# EasyEDA Pro project 云台PCB.epro

# Schematic Schematic1_1
Board Name: Board1_1; Create Date: 2026-03-31; Page Name: P1; Project Name: PT_head; Schematic Name: Schematic1_1; Update Date: 2026-03-31; Company: 嘉立创EDA; Page Size: A4; Version: V1.0
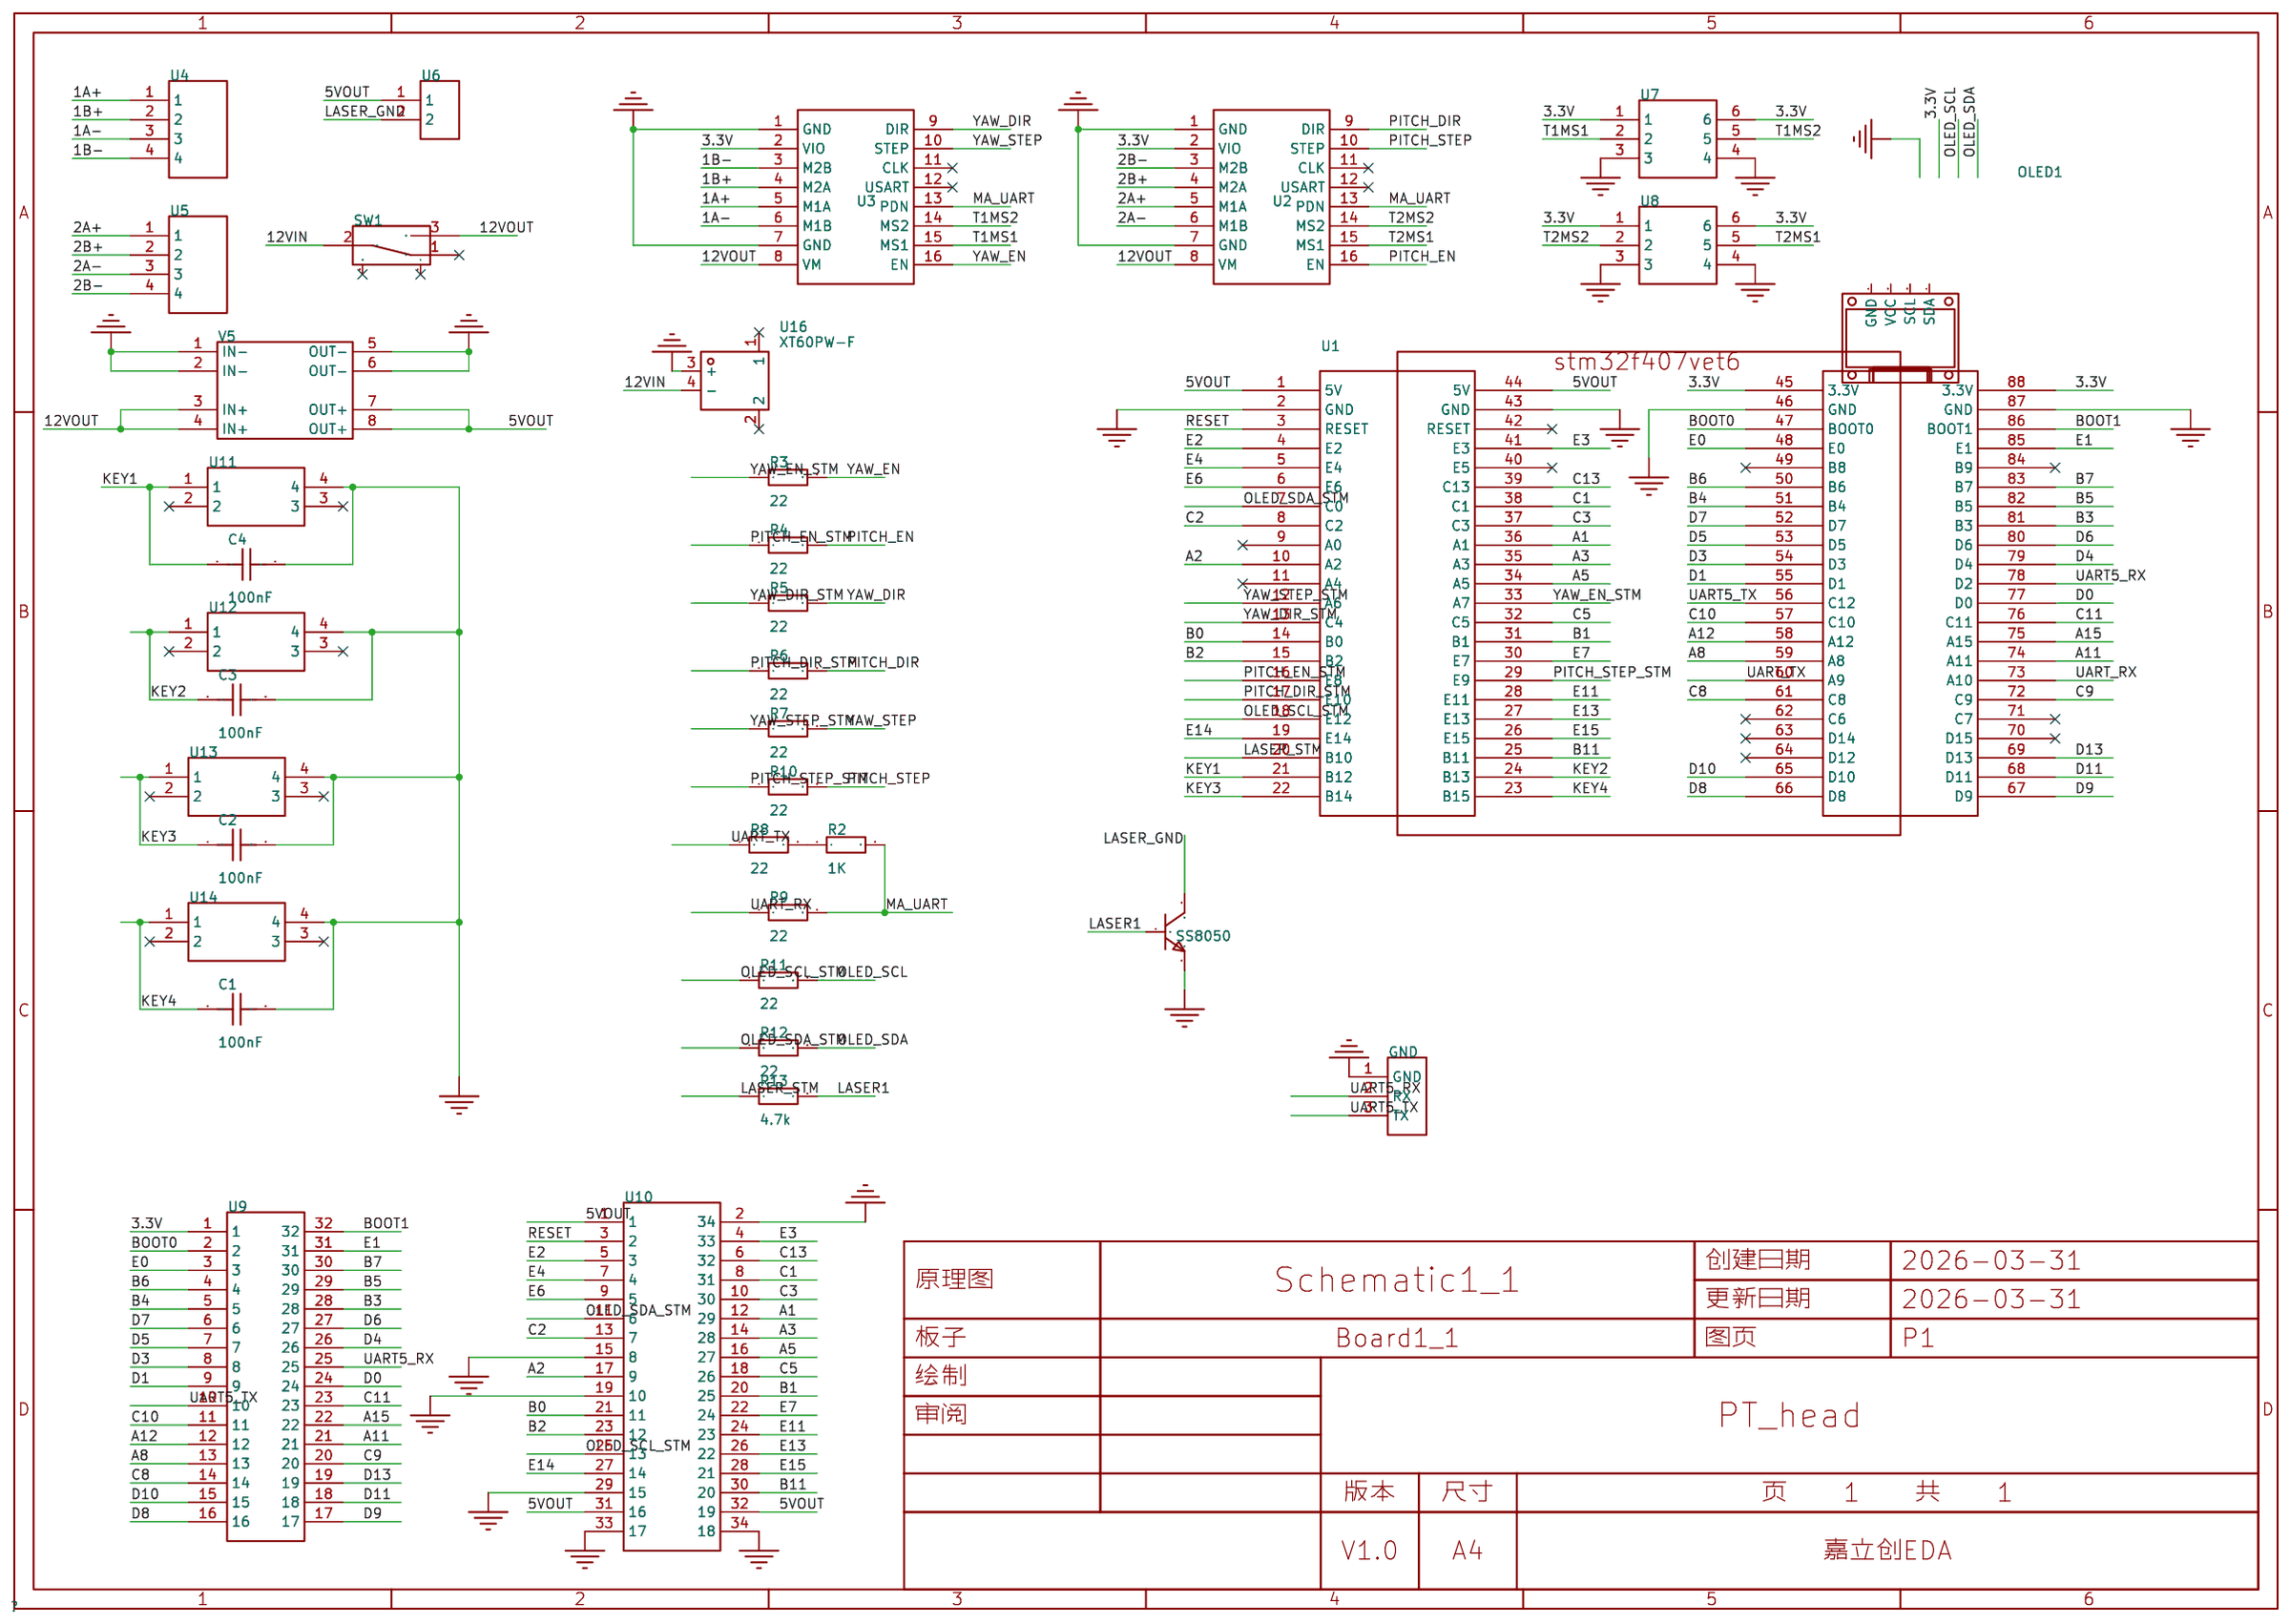
[diagram p0: schematic sheet]

## Parts
C1  100nF  [C0805]
C2  100nF  [C0805]
C3  100nF  [C0805]
C4  100nF  [C0805]
GND  -  [3PIN]
OLED1  -  [0.96OLED_4P]
Q1  SS8050  [SS8050]
R2  1K  [R0805]
R3  22  [R0805]
R4  22  [R0805]
R5  22  [R0805]
R6  22  [R0805]
R7  22  [R0805]
R8  22  [R0805]
R9  22  [R0805]
R10  22  [R0805]
R11  22  [R0805]
R12  22  [R0805]
R13  4.7k  [R0805]
SW1  -  [拨动开关_侧]
U1  -  [STM32核心板_V5]
U2  TMC2209  [TMC2209]
U3  TMC2209  [TMC2209]
U4  -  [2.54*4]
U5  -  [2.54*4]
U6  -  [1*2P]
U7  -  [2*3p]
U8  -  [2*3p]
U9  -  [2*16pin_2.54]
U10  -  [2*17P-2.54]
U11  -  [按键]
U12  -  [按键]
U13  -  [按键]
U14  -  [按键]
U16  XT60PW-F  [TH_2P-XT60PW-F]
V5  -  [MP1584EN]

## Library data of the parts
C1-C4 = CAP_0805: Supplier Footprint: 0805
GND = uart
OLED1 = 0.96OLED模块_4P: Supplier Footprint: 插件
Q1 = SS8050: Supplier: LCSC; Manufacturer: CJ; image: //image.lceda.cn/szlcsc/C2150.jpg; Supplier Part: C2150; JLCPCB Part Class: Basic
R2-R13 = Res_0805: Supplier Footprint: 0805
SW1 = 拨动开关_侧: Supplier Footprint: 插件
U1 = stm32f407vet6内置daplink
U2 U3 = TMC2209
U4 U5 = 2.54*4
U6 = laser2pin
U7 U8 = tmc2209地址
U9 = stm32排针2
U10 = stm32排针1
U11-U14 = 按键
U16 = XT60PW-F: LCSC Part Name: AMASS(艾迈斯)插头锂电池组充电接头 线到板连接器大电流30A连接器 航模电调卧式焊板 母头XT60PW-F.G.Y; Supplier Part: C428722; Manufacturer: AMASS(艾迈斯); JLCPCB Part Class: Extended Part; Datasheet: https://item.szlcsc.com/datasheet/XT60PW-F/423834.html; Supplier: LCSC; colour: 黄色; Connector type: 卧式插头; interface form: 母头
V5 = MP1584EN

## Nets
3.3V: U1.45(3.3V) U1.88(3.3V) U2.2(VIO) U3.2(VIO) U7.1 U7.6 U8.1 U8.6 U9.1
5VOUT: U1.1(5V) U1.44(5V) U6.1 U10.1 U10.31(16) U10.32(19) V5.7(OUT+) V5.8(OUT+)
12VIN: SW1.2 U16.4(-)
12VOUT: SW1.3 U2.8(VM) U3.8(VM) V5.3(IN+) V5.4(IN+)
GND: C1.2 C2.2 C3.2 C4.2 GND.1(GND) Q1.2(E) U1.2(GND) U1.43(GND) U1.46(GND) U1.87(GND) U2.1(GND) U2.7(GND) U3.1(GND) U3.7(GND) U7.3 U7.4 U8.3 U8.4 U10.2(34) U10.15(8) U10.19(10) U10.29(15) U10.33(17) U10.34(18) U11.4 U12.4 U13.4 U14.4 U16.3(+) V5.1(IN-) V5.2(IN-) V5.5(OUT-) V5.6(OUT-)
1A+: U3.5(M1A) U4.1
1A-: U3.6(M1B) U4.3
1B+: U3.4(M2A) U4.2
1B-: U3.3(M2B) U4.4
2A+: U2.5(M1A) U5.1
2A-: U2.6(M1B) U5.3
2B+: U2.4(M2A) U5.2
2B-: U2.3(M2B) U5.4
A1: U1.36(A1) U10.12(29)
A2: U1.10(A2) U10.17(9)
A3: U1.35(A3) U10.14(28)
A5: U1.34(A5) U10.16(27)
A8: U1.59(A8) U9.13
A11: U1.74(A11) U9.21
A12: U1.58(A12) U9.12
A15: U1.75(A15) U9.22
B0: U1.14(B0) U10.21(11)
B1: U1.31(B1) U10.20(25)
B2: U1.15(B2) U10.23(12)
B3: U1.81(B3) U9.28
B4: U1.51(B4) U9.5
B5: U1.82(B5) U9.29
B6: U1.50(B6) U9.4
B7: U1.83(B7) U9.30
B11: U1.25(B11) U10.30(20)
BOOT0: U1.47(BOOT0) U9.2
BOOT1: U1.86(BOOT1) U9.32
C1: U1.38(C1) U10.8(31)
C2: U1.8(C2) U10.13(7)
C3: U1.37(C3) U10.10(30)
C5: U1.32(C5) U10.18(26)
C8: U1.61(C8) U9.14
C9: U1.72(C9) U9.20
C10: U1.57(C10) U9.11
C11: U1.76(C11) U9.23
C13: U1.39(C13) U10.6(32)
D0: U1.77(D0) U9.24
D1: U1.55(D1) U9.9
D3: U1.54(D3) U9.8
D4: U1.79(D4) U9.26
D5: U1.53(D5) U9.7
D6: U1.80(D6) U9.27
D7: U1.52(D7) U9.6
D8: U1.66(D8) U9.16
D9: U1.67(D9) U9.17
D10: U1.65(D10) U9.15
D11: U1.68(D11) U9.18
D13: U1.69(D13) U9.19
E0: U1.48(E0) U9.3
E1: U1.85(E1) U9.31
E2: U1.4(E2) U10.5(3)
E3: U1.41(E3) U10.4(33)
E4: U1.5(E4) U10.7(4)
E6: U1.6(E6) U10.9(5)
E7: U1.30(E7) U10.22(24)
E11: U1.28(E11) U10.24(23)
E13: U1.27(E13) U10.26(22)
E14: U1.19(E14) U10.27(14)
E15: U1.26(E15) U10.28(21)
KEY1: C4.1 U1.21(B12) U11.1
KEY2: C3.1 U1.24(B13) U12.1
KEY3: C2.1 U1.22(B14) U13.1
KEY4: C1.1 U1.23(B15) U14.1
LASER1: Q1.1(B) R13.2
LASER_GND: Q1.3(C) U6.2
LASER_STM: R13.1 U1.20(B10)
MA_UART: R2.2 R9.2 U2.13(PDN) U3.13(PDN)
OLED_SCL: R11.2
OLED_SCL_STM: R11.1 U1.18(E12) U10.25(13)
OLED_SDA: R12.2
OLED_SDA_STM: R12.1 U1.7(C0) U10.11(6)
PITCH_DIR: R6.2 U2.9(DIR)
PITCH_DIR_STM: R6.1 U1.17(E10)
PITCH_EN: R4.2 U2.16(EN)
PITCH_EN_STM: R4.1 U1.16(E8)
PITCH_STEP: R10.2 U2.10(STEP)
PITCH_STEP_STM: R10.1 U1.29(E9)
RESET: U1.3(RESET) U10.3(2)
T1MS1: U3.15(MS1) U7.2
T1MS2: U3.14(MS2) U7.5
T2MS1: U2.15(MS1) U8.5
T2MS2: U2.14(MS2) U8.2
UART5_RX: GND.2(RX) U1.78(D2) U9.25
UART5_TX: GND.3(TX) U1.56(C12) U9.10
UART_RX: R9.1 U1.73(A10)
UART_TX: R8.1 U1.60(A9)
YAW_DIR: R5.2 U3.9(DIR)
YAW_DIR_STM: R5.1 U1.13(C4)
YAW_EN: R3.2 U3.16(EN)
YAW_EN_STM: R3.1 U1.33(A7)
YAW_STEP: R7.2 U3.10(STEP)
YAW_STEP_STM: R7.1 U1.12(A6)
$1N2243: R2.1 R8.2

Not connected (* = marked no-connect by the designer): OLED1 1(GND) 2(VCC) 3(SCL) 4(SDA); SW1 1* 4* 5*; U1 9(A0)* 11(A4)* 40(E5)* 42(RESET)* 49(B8)* 62(C6)* 63(D14)* 64(D12)* 70(D15)* 71(C7)* 84(B9)*; U2 11(CLK)* 12(USART)*; U3 11(CLK)* 12(USART)*; U11 2* 3*; U12 2* 3*; U13 2* 3*; U14 2* 3*; U16 1* 2*

# Board PCB1_1
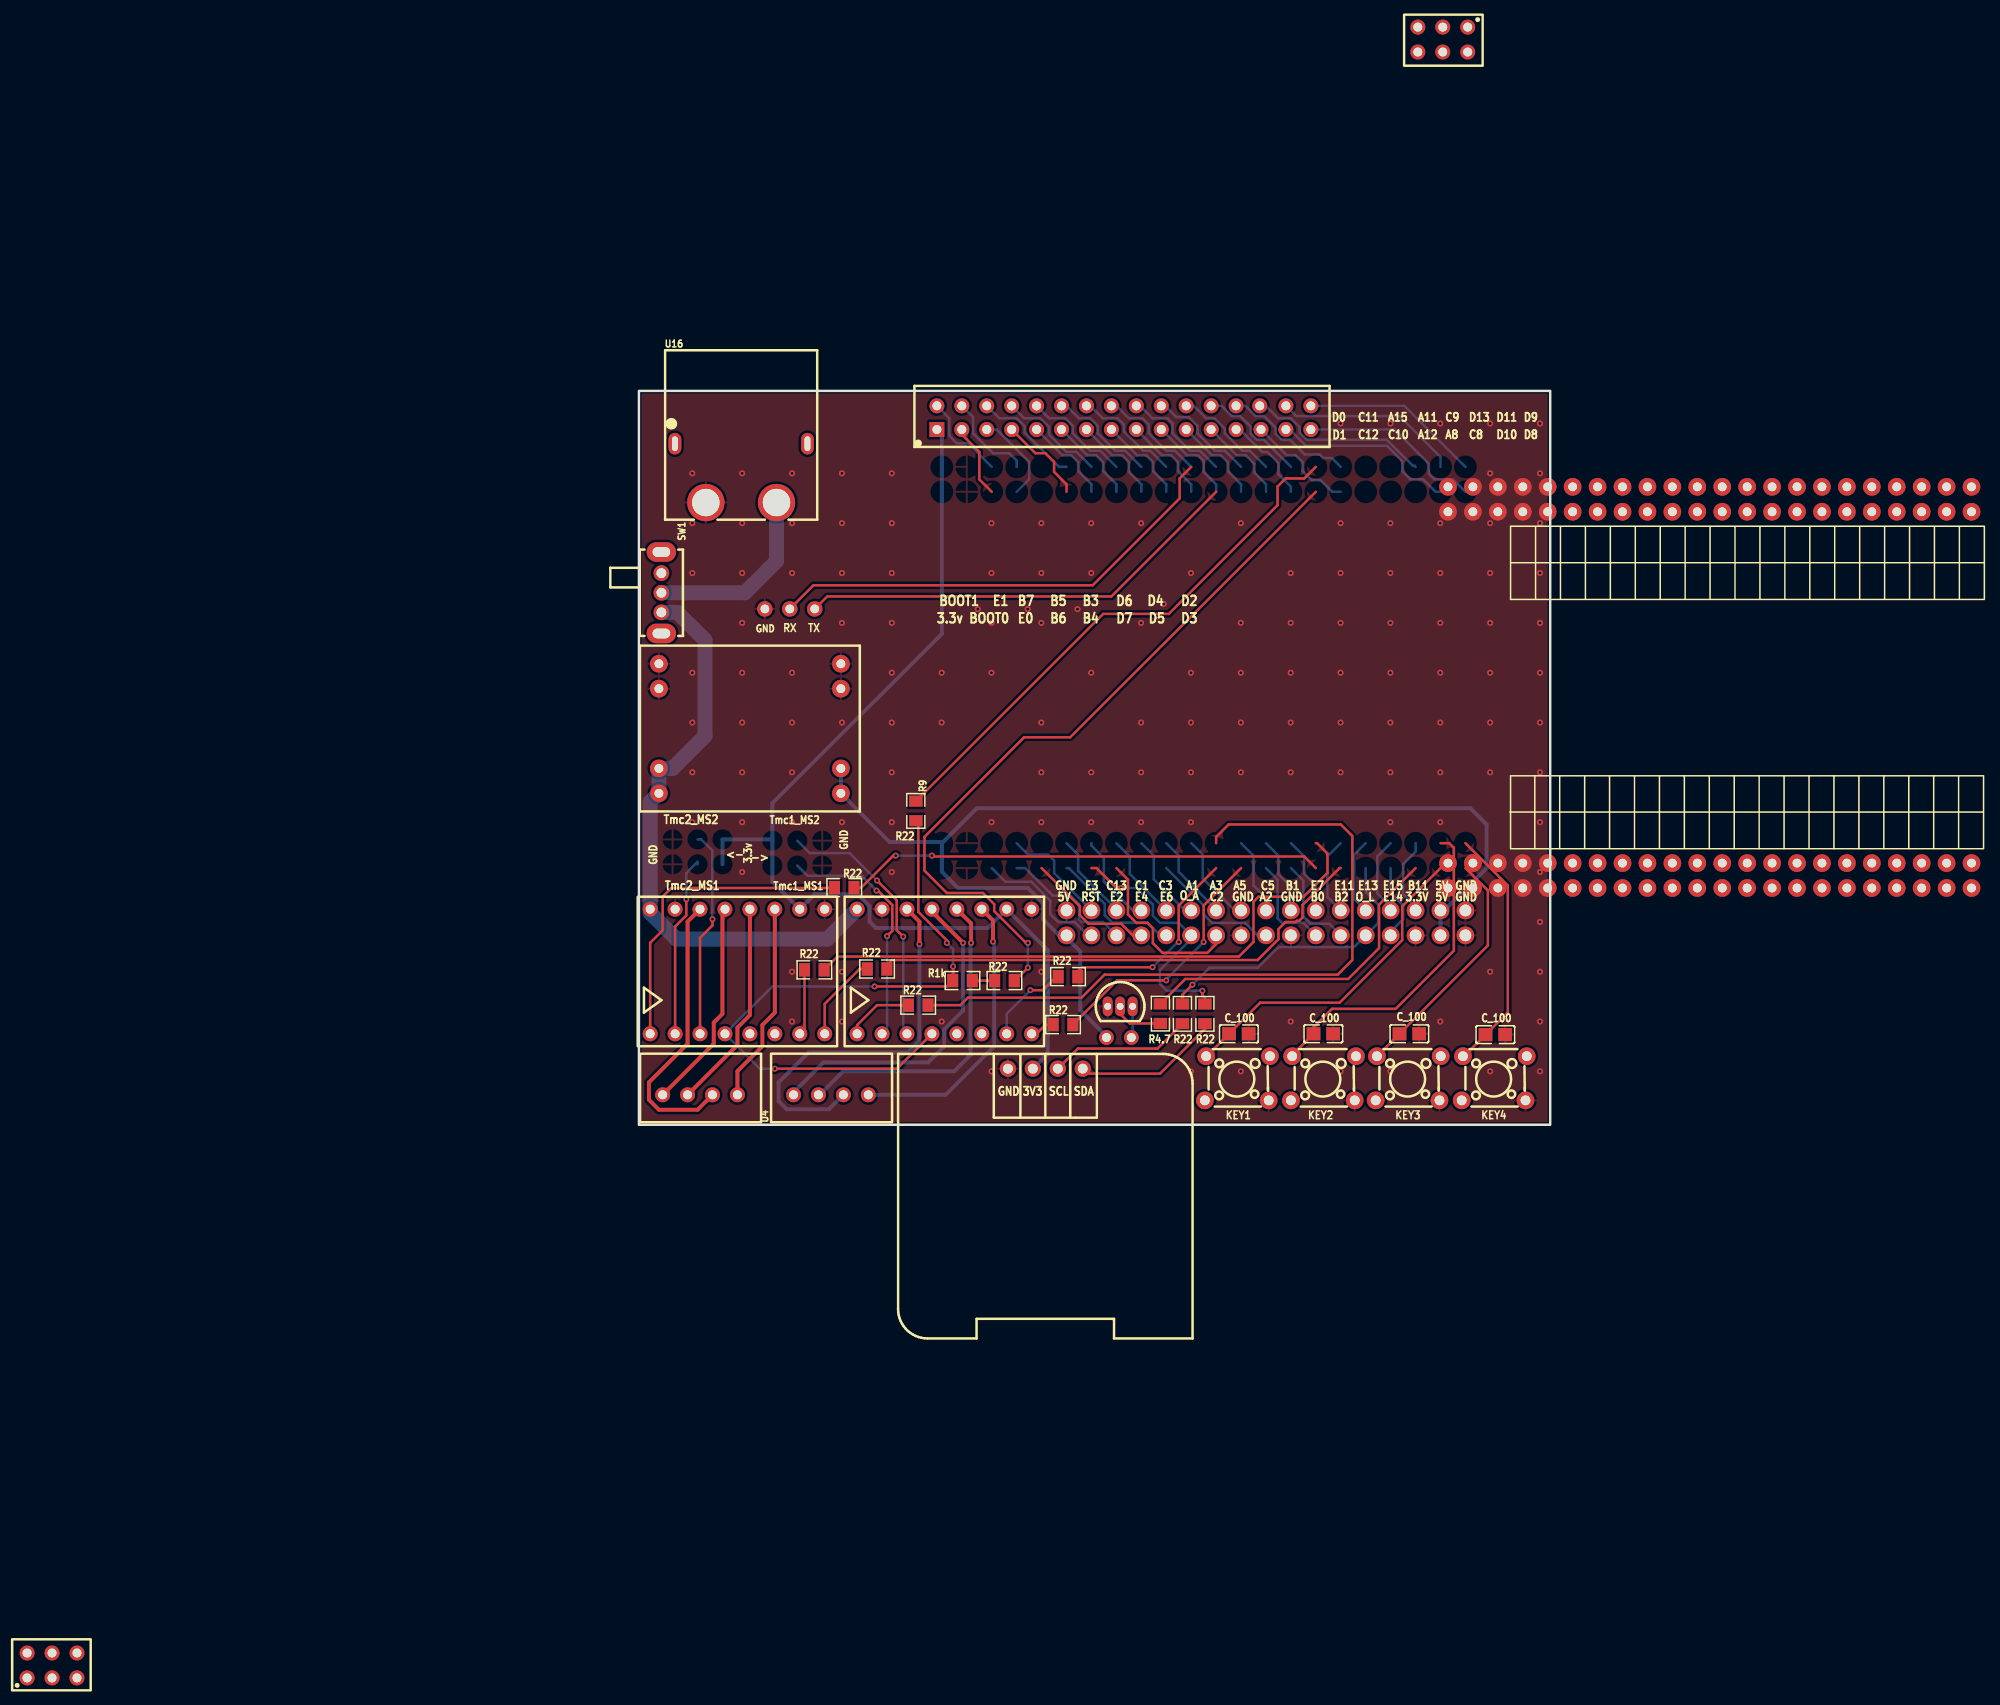
[diagram p1: board, top side]
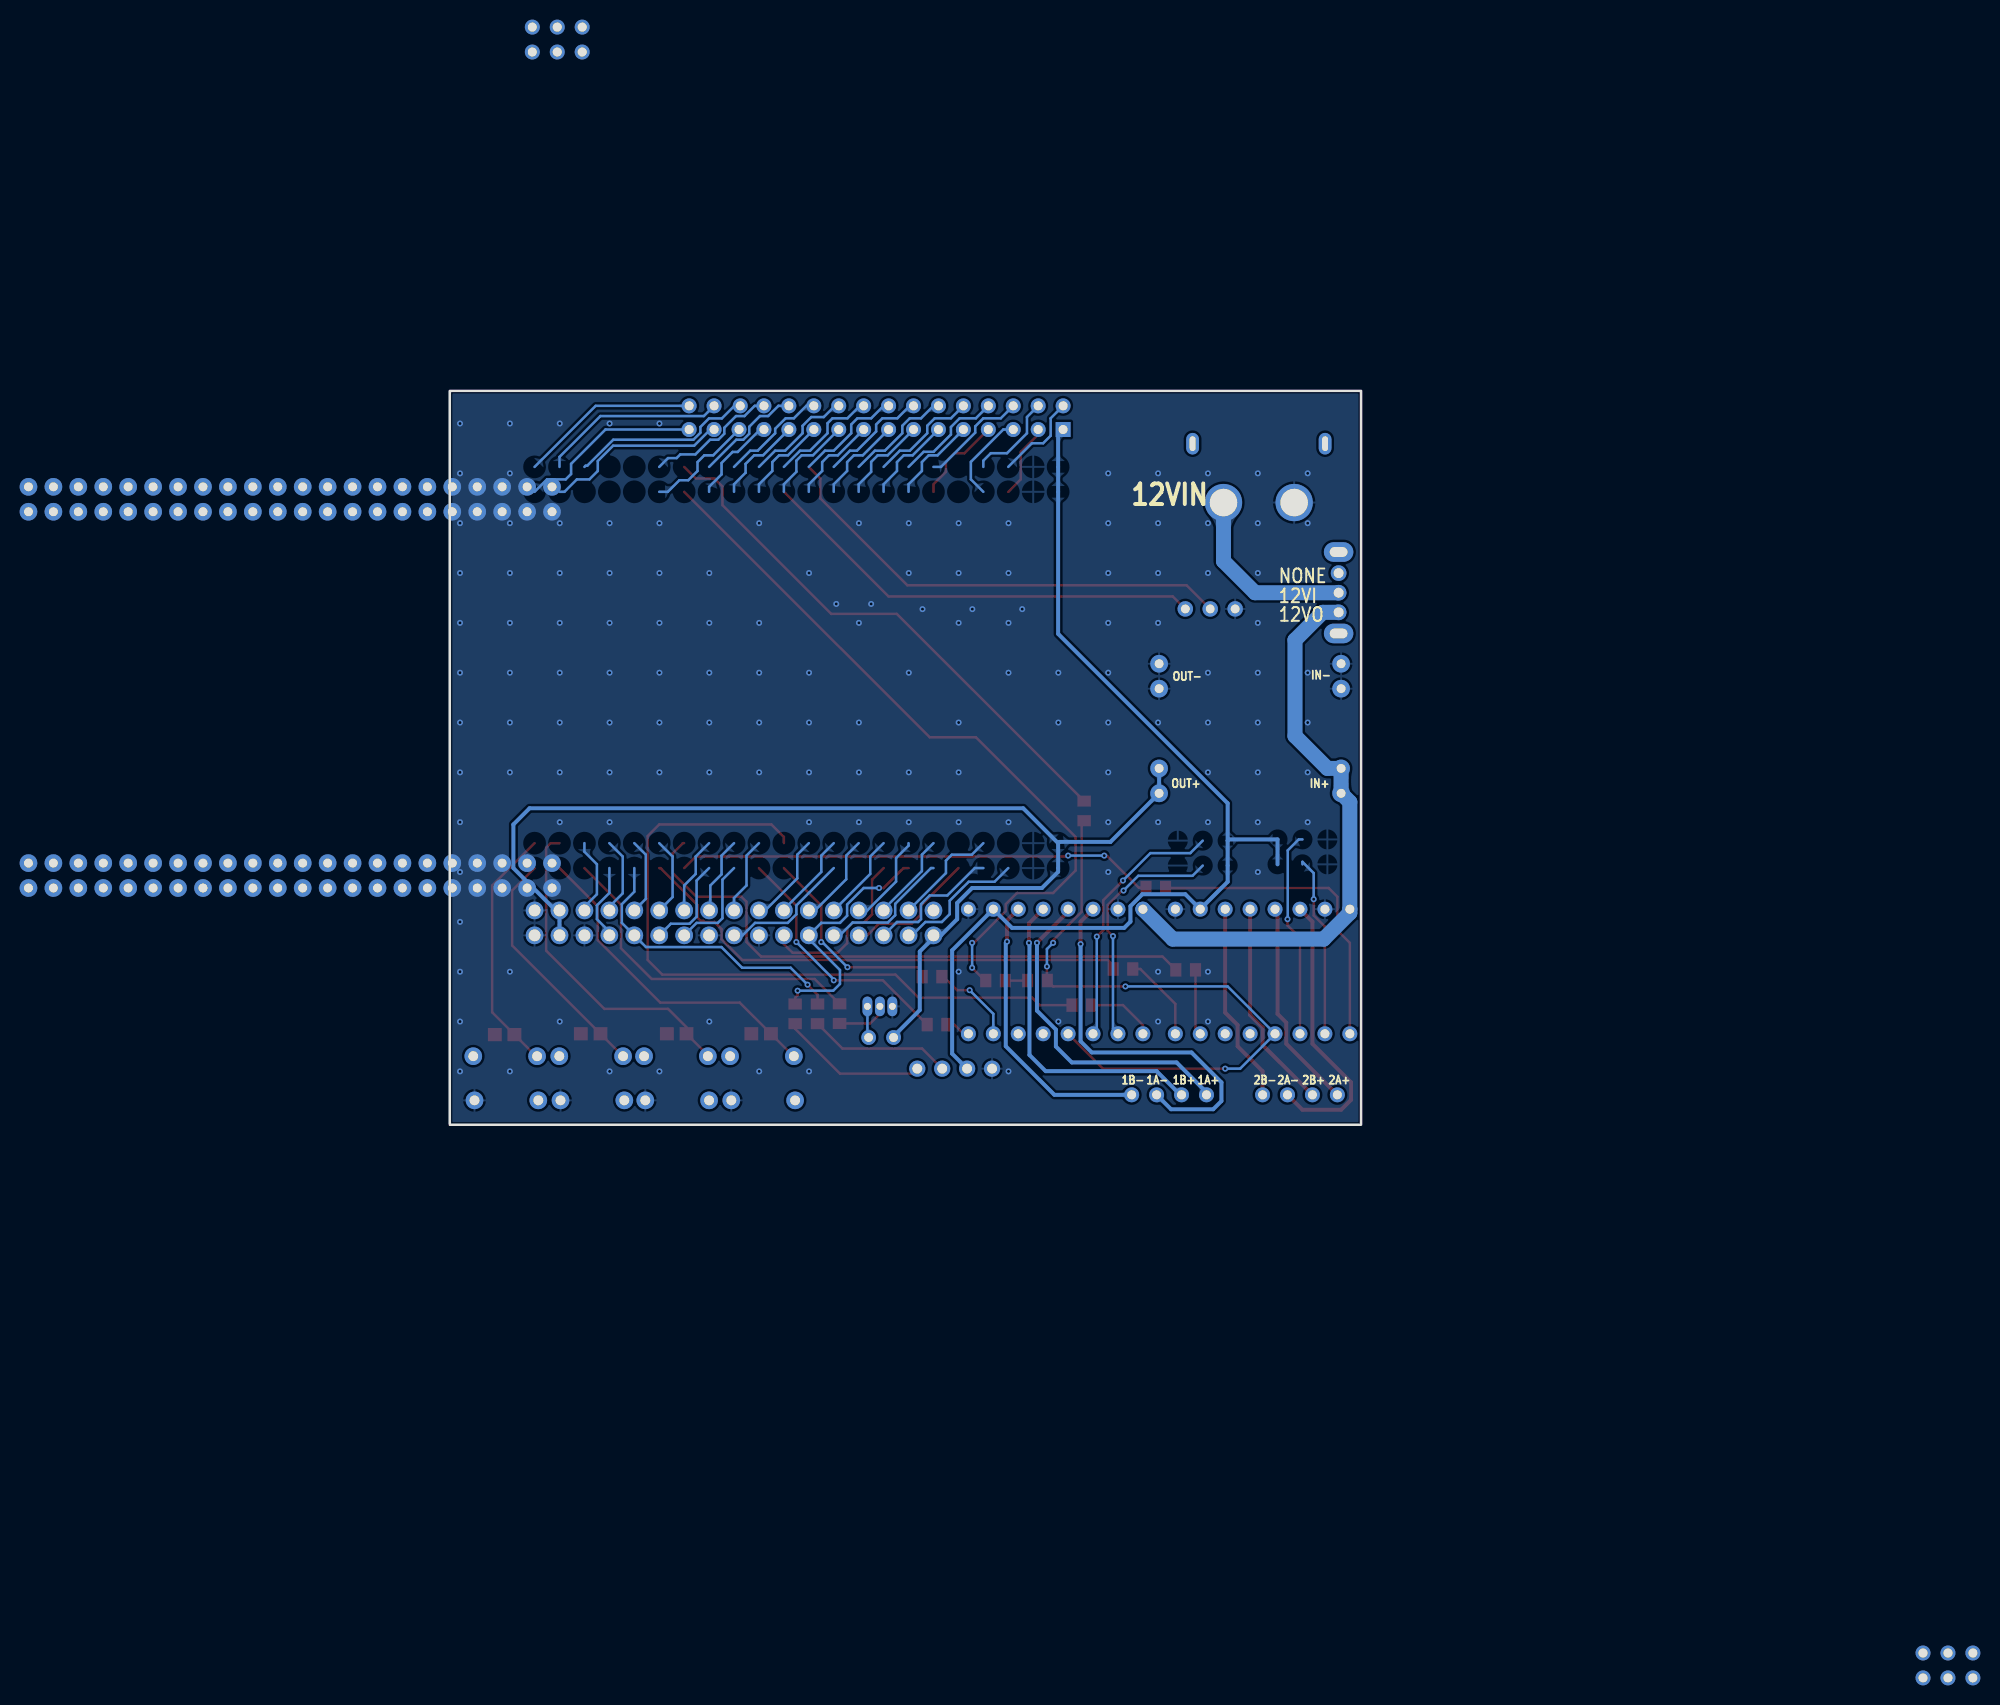
[diagram p2: board, bottom side, seen from below]

Outline 92.84 x 74.8 mm; copper layers: Top Layer, Bottom Layer. Coordinates in mm from the lower left corner of the outline.
Outline path: rectangle 0,74.8 92.84,0
Stack: Top Layer 0.035mm / Dielectric1 1.51mm FR4 er 4.5 / Bottom Layer 0.035mm

## Design rules (mm)
spacing copperThickness1oz (default): track to track 0.102, other pairs 0.152 to 0.3
spacing copperThickness2oz: track to track 0.203, other pairs 0.152 to 0.3
spacing Plane_innerPlane: track to track 0.102, other pairs 0.152 to 0.3
spacing Copper_copperRegion: track to track 0.102, other pairs 0.152 to 0.3
track width copperThickness1oz (default): min 0.127, default 0.254, max 2.54
track width copperThickness2oz: min 0.203, default 0.254, max 2.54
differential pair differentialPair (default): width min 0.127, default 0.254, max 2.54; gap min 0.152, default 0.152
pour e818 uses Copper_copperRegion
pour e934 uses Copper_copperRegion

## Placement (name value [footprint] x y rotation side)
C1  100nF  [C0805]  87.25 9.18 0 top
C2  100nF  [C0805]  78.49 9.27 0 top
C3  100nF  [C0805]  69.72 9.27 0 top
C4  100nF  [C0805]  61.12 9.27 0 top
GND  -  [3PIN]  15.37 52.58 0 top
OLED1  -  [0.96OLED_4P]  41.4 5.72 0 top
Q1  -  [SS8050]  49.02 12.06 0 top
R2  1K  [R0805]  32.96 14.7 180 top
R3  22  [R0805]  28.45 12.19 180 top
R4  22  [R0805]  20.91 24.17 180 top
R5  22  [R0805]  43.2 10.21 180 top
R6  22  [R0805]  24.26 15.88 180 top
R7  22  [R0805]  43.71 15.1 180 top
R8  22  [R0805]  37.23 14.7 180 top
R9  22  [R0805]  28.21 31.99 270 top
R10  22  [R0805]  17.87 15.79 180 top
R11  22  [R0805]  55.37 11.3 270 top
R12  22  [R0805]  57.66 11.3 270 top
R13  4.7k  [R0805]  53.12 11.32 270 top
SW1  -  [拨动开关_侧]  2.29 54.23 270 top
U1  -  [STM32核心板_V5]  84.2 26.16 90 top
U2  -  [TMC2209]  20.32 23.37 270 top
U3  -  [TMC2209]  41.4 23.37 270 top
U4  -  [2.54*4]  20.95 3.05 90 top
U5  -  [2.54*4]  7.62 3.05 90 top
U6  -  [1*2P]  48.9 8.89 90 top
U7  -  [2*3p]  18.67 26.42 90 top
U8  -  [2*3p]  3.43 29.08 270 top
U9  -  [2*16pin_2.54]  48.01 71.88 0 top
U10  -  [2*17P-2.54]  52.45 20.57 0 top
U11  -  [按键]  91.06 9.02 0 top
U12  -  [按键]  99.82 9.02 0 top
U13  -  [按键]  108.46 9.02 0 top
U14  -  [按键]  117.22 9.02 0 top
U16  XT60PW-F  [TH_2P-XT60PW-F]  10.41 66.42 0 top
V5  -  [MP1584EN]  10.54 40.89 0 top

## Footprints (pads in the part's own frame, mm; a bottom-side part is the same pattern mirrored in y, then rotated)
0.96OLED_4P
  round 1.65 hole 1: 1(-3.81,-0.002) 2(-1.27,0.002) 3(1.27,0.002) 4(3.81,0.002)
1*2P
  round 1.5 hole 0.9: 1(0,1.27) 2(0,-1.27)
2*3p
  round 1.524 hole 0.914: 1(-82.804,81.002) 2(-82.804,78.463) 3(-82.804,75.922) 4(-80.264,75.922) 5(-80.264,78.463) 6(-80.264,81.002)
2*16pin_2.54
  rect 1.524x1.524 hole 0.914: 1(-17.653,-1.016)
  round 1.524 hole 0.914: 2(-15.113,-1.016) 3(-12.573,-1.016) 4(-10.033,-1.016) 5(-7.493,-1.016) 6(-4.953,-1.016) 7(-2.413,-1.016) 8(0.127,-1.016) 9(2.667,-1.016) 10(5.207,-1.016) 11(7.747,-1.016) 12(10.287,-1.016) 13(12.827,-1.016) 14(15.367,-1.016) 15(17.907,-1.016) 16(20.447,-1.016) 17(20.447,1.397) 18(17.907,1.397) 19(15.24,1.397) 20(12.827,1.397) 21(10.287,1.397) 22(7.747,1.397) 23(5.207,1.397) 24(2.667,1.397) 25(0.127,1.397) 26(-2.413,1.397) 27(-4.953,1.397) 28(-7.493,1.397) 29(-10.033,1.397) 30(-12.573,1.397) 31(-15.113,1.397) 32(-17.653,1.397)
2*17P-2.54
  round 1.8 hole 1.2: 1(-8.89,-1.27) 2(-8.89,1.27) 3(-6.35,-1.27) 4(-6.35,1.27) 5(-3.81,-1.27) 6(-3.81,1.27) 7(-1.27,-1.27) 8(-1.27,1.27) 9(1.27,-1.27) 10(1.27,1.27) 11(3.81,-1.27) 12(3.81,1.27) 13(6.35,-1.27) 14(6.35,1.27) 15(8.89,-1.27) 16(8.89,1.27) 17(11.43,-1.27) 18(11.43,1.27) 19(13.97,-1.27) 20(13.97,1.27) 21(16.51,-1.27) 22(16.51,1.27) 23(19.05,-1.27) 24(19.05,1.27) 25(21.59,-1.27) 26(21.59,1.27) 27(24.13,-1.27) 28(24.13,1.27) 29(26.67,-1.27) 30(26.67,1.27) 31(29.21,-1.27) 32(29.21,1.27) 33(31.75,-1.27) 34(31.75,1.27)
2.54*4
  round 1.524 hole 0.914: 1(0,5.207) 2(0,2.667) 3(0,0.127) 4(0,-2.413)
3PIN
  round 1.575 hole 0.889: 1(-2.54,0) 2(0,0) 3(2.54,0)
C0805
  rect 1.41x1.35 smd: 1(-1,0) 2(1,0)
MP1584EN
  round 1.8 hole 0.9: 1(-8.509,6.096) 1(-8.509,3.556) 2(-8.509,-4.572) 2(-8.509,-7.112) 3(10.033,-4.572) 3(10.033,-7.112) 4(10.033,6.096) 4(10.033,3.556)
R0805
  rect 1.133x1.377 smd: 1(-1,0) 2(1,0)
SS8050
  oval 1x2 hole 0.7x0.705: 1(-1.27,0) 2(0,0) 3(1.27,0)
STM32核心板_V5
  round 1.8 hole 0.9: 1(-2.032,1.778) 2(-2.032,-0.762) 3(-2.032,-3.302) 4(-2.032,-5.842) 5(-2.032,-8.382) 6(-2.032,-10.922) 7(-2.032,-13.462) 8(-2.032,-16.002) 9(-2.032,-18.542) 10(-2.032,-21.082) 11(-2.032,-23.622) 12(-2.032,-26.162) 13(-2.032,-28.702) 14(-2.032,-31.242) 15(-2.032,-33.782) 16(-2.032,-36.322) 17(-2.032,-38.862) 18(-2.032,-41.402) 19(-2.032,-43.942) 20(-2.032,-46.482) 21(-2.032,-49.022) 22(-2.032,-51.562) 23(0.508,-51.562) 24(0.508,-49.022) 25(0.508,-46.482) 26(0.508,-43.942) 27(0.508,-41.402) 28(0.508,-38.862) 29(0.508,-36.322) 30(0.508,-33.782) 31(0.508,-31.242) 32(0.508,-28.702) 33(0.508,-26.162) 34(0.508,-23.622) 35(0.508,-21.082) 36(0.508,-18.542) 37(0.508,-16.002) 38(0.508,-13.462) 39(0.508,-10.922) 40(0.508,-8.382) 41(0.508,-5.842) 42(0.508,-3.302) 43(0.508,-0.762) 44(0.508,1.778) 45(36.322,1.778) 46(36.322,-0.762) 47(36.322,-3.302) 48(36.322,-5.842) 49(36.322,-8.382) 50(36.322,-10.922) 51(36.322,-13.462) 52(36.322,-16.002) 53(36.322,-18.542) 54(36.322,-21.082) 55(36.322,-23.622) 56(36.322,-26.162) 57(36.322,-28.702) 58(36.322,-31.242) 59(36.322,-33.782) 60(36.322,-36.322) 61(36.322,-38.862) 62(36.322,-41.402) 63(36.322,-43.942) 64(36.322,-46.482) 65(36.322,-49.022) 66(36.322,-51.562) 67(38.862,-51.562) 68(38.862,-49.022) 69(38.862,-46.482) 70(38.862,-43.942) 71(38.862,-41.402) 72(38.862,-38.862) 73(38.862,-36.322) 74(38.862,-33.782) 75(38.862,-31.242) 76(38.862,-28.702) 77(38.862,-26.162) 78(38.862,-23.622) 79(38.862,-21.082) 80(38.862,-18.542) 81(38.862,-16.002) 82(38.862,-13.462) 83(38.862,-10.922) 84(38.862,-8.382) 85(38.862,-5.842) 86(38.862,-3.302) 87(38.862,-0.762) 88(38.862,1.778)
TH_2P-XT60PW-F
  oval 1.3x2.2 hole 0.6x1.5: 1(-6.75,3) 2(6.75,3)
  round 3.8 hole 2.8: 3(-3.6,-3) 4(3.6,-3)
TMC2209
  round 1.524 hole 0.914: 1(1.397,-1.397) 2(1.397,-3.937) 3(1.397,-6.477) 4(1.397,-9.017) 5(1.397,-11.557) 6(1.397,-14.097) 7(1.397,-16.637) 8(1.397,-19.177) 9(14.097,-1.397) 10(14.097,-3.937) 11(14.097,-6.477) 12(14.097,-9.017) 13(14.097,-11.557) 14(14.097,-14.097) 15(14.097,-16.637) 16(14.097,-19.177)
拨动开关_侧
  oval 1.6x1.6 hole 1.001: 1(-1.999,0) 2(0,0) 3(1.999,0)
  oval 1.999x2.999 hole 1.001x1.801: 4(4.151,0) 5(-4.151,0)
按键
  round 1.8 hole 1: 1(-33.274,-2.032) 2(-26.774,-2.032) 3(-33.401,-6.532) 4(-26.901,-6.532)

## Nets
As in the schematic, except:
3.3V: OLED1.2 U1.45 U1.88 U2.2 U3.2 U7.1 U7.6 U8.1 U8.6 U9.1
5VOUT: U1.1 U1.44 U6.1 U10.1 U10.31 U10.32 V5.3
12VOUT: SW1.3 U2.8 U3.8 V5.2
GND: C1.2 C2.2 C3.2 C4.2 GND.1 OLED1.1 Q1.1 U1.2 U1.43 U1.46 U1.87 U2.1 U2.7 U3.1 U3.7 U7.3 U7.4 U8.3 U8.4 U10.2 U10.15 U10.19 U10.29 U10.33 U10.34 U11.4 U12.4 U13.4 U14.4 U16.3 V5.1 V5.4
LASER1: Q1.2 R13.2
OLED_SCL: OLED1.3 R11.2
OLED_SDA: OLED1.4 R12.2

Pads without a net: SW1 1 4 5; U1 9 11 40 42 49 62 63 64 70 71 84; U2 11 12; U3 11 12; U11 2 3; U12 2 3; U13 2 3; U14 2 3; U16 1 2

## Via types
v1: diameter 0.61, hole 0.305, Top Layer to Bottom Layer, 167 vias

## Routing (per net, layer and track width the routed paths; a pad name or vN(x,y) marks a point on that pad's centre or on a via; arc(x,y) is an arc through that point)
3.3V: length 108.6
  Bottom Layer w0.4: 13.59,28.96 13.46,29.08 8.51,29.08 8.51,26.54 ; 13.59,28.96 13.59,24.77 U2.2 17.91,23.49 22.28,23.49 23.5,22.28 23.5,20.7 24.13,20.07 35.56,20.07 U3.2 41.66,17.78 41.66,7.24 OLED1.2 ; 13.59,28.96 13.59,32.77 30.86,50.04 30.86,70.36 30.35,70.87
5VOUT: length 117.4
  Bottom Layer w0.4: 20.57,36.32 V5.3 25.53,28.83 30.73,28.83 30.86,28.7 ; 30.86,28.7 34.42,32.26 84.71,32.26 86.36,30.61 86.36,26.16 82.04,21.84 U10.32 U10.31 ; 30.86,28.7 30.86,25.78 32.51,24.13 39.62,24.13 41.15,22.61 41.15,20.95 42.8,19.3 U10.1 43.56,19.05 44.96,17.65 44.96,11.68 47.62,9.02 U6.1
12VIN: length 19
  Bottom Layer w1.524: U16.4 14.01,57.45 10.8,54.23 SW1.2
12VOUT: length 60
  Bottom Layer w1.524: U3.8 19.18,18.92 3.81,18.92 1.14,21.59 U2.8 1.14,32.89 V5.2 2.03,36.32 3.43,36.32 6.73,39.62 6.73,49.4 3.9,52.23 SW1.3
GND:
  vias: v1(5.44,66.4) v1(5.44,61.32) v1(5.44,56.24) v1(5.44,46.08) v1(5.44,41) v1(5.44,35.92) v1(5.44,30.84) v1(10.52,66.4) v1(10.52,61.32) v1(10.52,56.24) v1(10.52,51.16) v1(10.52,46.08) v1(10.52,41) v1(10.52,35.92) v1(10.52,30.84) v1(10.52,25.76) v1(15.6,66.4) v1(15.6,61.32) v1(15.6,56.24) v1(15.6,46.08) v1(15.6,41) v1(15.6,35.92) v1(15.6,30.84) v1(15.6,15.6) v1(15.6,10.52) v1(20.68,66.4) v1(20.68,61.32) v1(20.68,56.24) v1(20.68,51.16) v1(20.68,41) v1(20.68,30.84) v1(20.68,15.6) v1(20.68,10.52) v1(25.76,66.4) v1(25.76,61.32) v1(25.76,56.24) v1(25.76,51.16) v1(25.76,46.08) v1(25.76,41) v1(25.76,35.92) v1(25.76,30.84) v1(25.76,25.76) v1(30.84,46.08) v1(30.84,41) v1(30.84,10.52) v1(34.52,52.55) v1(35.92,61.32) v1(35.92,56.24) v1(35.92,51.16) v1(35.92,46.08) v1(35.92,30.84) v1(35.92,5.44) v1(39.6,52.55) v1(41,61.32) v1(41,56.24) v1(41,51.16) v1(41,41) v1(41,35.92) v1(41,30.84) v1(41,15.6) v1(44.68,52.55) v1(46.08,61.32) v1(46.08,56.24) v1(46.08,46.08) v1(46.08,35.92) v1(46.08,30.84) v1(49.91,53.09) v1(51.16,61.32) v1(51.16,51.16) v1(51.16,41) v1(51.16,35.92) v1(51.16,30.84) v1(53.47,53.09) v1(56.24,56.24) v1(56.24,46.08) v1(56.24,41) v1(56.24,35.92) v1(56.24,30.84) v1(56.24,5.44) v1(61.32,61.32) v1(61.32,51.16) v1(61.32,46.08) v1(61.32,41) v1(61.32,35.92) v1(61.32,5.44) v1(66.4,56.24) v1(66.4,51.16) v1(66.4,46.08) v1(66.4,41) v1(66.4,35.92) v1(66.4,10.52) v1(71.48,71.48) v1(71.48,61.32) v1(71.48,56.24) v1(71.48,51.16) v1(71.48,46.08) v1(71.48,41) v1(71.48,35.92) v1(71.48,5.44) v1(76.56,71.48) v1(76.56,61.32) v1(76.56,56.24) v1(76.56,51.16) v1(76.56,46.08) v1(76.56,41) v1(76.56,35.92) v1(76.56,30.84) v1(76.56,5.44) v1(81.64,71.48) v1(81.64,61.32) v1(81.64,56.24) v1(81.64,51.16) v1(81.64,46.08) v1(81.64,41) v1(81.64,35.92) v1(81.64,30.84) v1(81.64,10.52) v1(86.72,71.48) v1(86.72,66.4) v1(86.72,61.32) v1(86.72,56.24) v1(86.72,51.16) v1(86.72,46.08) v1(86.72,41) v1(86.72,35.92) v1(86.72,15.6) v1(86.72,5.44) v1(91.8,71.48) v1(91.8,66.4) v1(91.8,61.32) v1(91.8,56.24) v1(91.8,51.16) v1(91.8,46.08) v1(91.8,41) v1(91.8,35.92) v1(91.8,30.84) v1(91.8,25.76) v1(91.8,20.68) v1(91.8,15.6) v1(91.8,10.52) v1(91.8,5.44)
1A+: length 33.6
  Top Layer w0.4: U3.5 29.84,21.72 v1(33.02,18.54)
  Bottom Layer w0.4: v1(33.02,18.54) 33.02,11.63 31.09,9.7 31.09,7.98 29.46,6.35 18.8,6.35 15.75,3.3 U4.1
1A-: length 39.5
  Top Layer w0.4: U3.6 28.57,20.7 v1(28.57,18.41)
  Bottom Layer w0.4: v1(28.57,18.41) 28.57,8.51 27.43,7.37 17.27,7.37 14.22,4.32 14.22,2.41 15.06,1.58 19.36,1.58 U4.3
1B+: length 32.6
  Top Layer w0.4: U3.4 33.84,20.52 v1(33.84,18.54)
  Bottom Layer w0.4: 33.78,18.54 33.78,7.11 32.13,5.46 20.83,5.46 18.42,3.05 U4.2
1B-: length 29.4
  Top Layer w0.4: U3.3 36.07,20.83 v1(36.07,18.67)
  Bottom Layer w0.4: v1(36.07,18.67) 36.19,18.54 36.19,8 31.24,3.05 U4.4
2A+: length 21.6
  Top Layer w0.4: 2.41,3.05 7.62,8.25 7.62,10.41 8.51,11.3 8.51,21.72 8.76,21.97
2A-: length 29.1
  Top Layer w0.4: U2.6 4.95,20.7 4.95,8.25 1.02,4.32 1.02,2.54 2.03,1.52 5.97,1.52 7.49,3.05
2B+: length 21.6
  Top Layer w0.4: U5.2 10.03,8.13 10.03,9.91 11.3,11.18 U2.4
2B-: length 20.5
  Top Layer w0.4: 13.84,21.97 13.84,11.43 12.57,10.16 12.57,8 10.03,5.46 U5.4
A1: length 9.3
  Bottom Layer w0.254: U10.12 55.63,21.84 52.45,25.02 52.45,27.43 51.18,28.7
A2: length 13.5
  Bottom Layer w0.254: 53.72,26.16 57.53,22.35 57.53,21.45 58.4,20.57 61.74,20.57 63.01,19.3 U10.17
A3: length 9
  Bottom Layer w0.254: 53.72,28.7 54.99,27.43 54.99,25.76 58.8,21.95 U10.14
A5: length 9.3
  Bottom Layer w0.254: 56.26,28.7 57.44,27.52 57.44,25.11 60.71,21.84 U10.16
A8: length 9.2
  Bottom Layer w0.254: 66.42,64.52 66.42,65.02 65.15,66.29 65.15,67.45 64.02,68.58 63.5,68.58 61.21,70.87 60.83,70.87
A11: length 11.1
  Bottom Layer w0.254: U9.21 59.36,73.28 60.4,72.24 61.24,72.24 62.33,71.14 62.33,70.44 62.94,69.83 63.65,69.83 66.42,67.06
A12: length 9.2
  Bottom Layer w0.254: 63.88,64.52 63.88,65.28 62.7,66.46 62.7,67.36 61.83,68.23 60.92,68.23 58.29,70.87
A15: length 11
  Bottom Layer w0.254: U9.22 56.51,73.28 57.78,72.01 58.62,72.01 59.69,70.94 59.69,70.48 61.47,68.71 62.23,68.71 63.88,67.06
B0: length 10.2
  Bottom Layer w0.254: 63.88,26.16 65.06,24.98 65.06,21.05 65.53,20.57 67.69,20.57 U10.21
B1: length 7.9
  Bottom Layer w0.254: U10.20 66.29,21.97 66.29,24.38 65.15,25.53 65.15,27.43 63.88,28.7
B2: length 10.1
  Bottom Layer w0.254: 66.42,26.16 67.69,24.89 67.69,21.21 68.42,20.48 70.32,20.48 U10.23
B3: length 11.2
  Bottom Layer w0.254: U9.28 41.78,72.01 43.43,72.01 44.2,71.25 44.2,70.48 45.97,68.71 46.99,68.71 48.64,67.06
B4: length 9.2
  Bottom Layer w0.254: 40.51,70.87 43.14,68.23 44.05,68.23 44.74,67.54 44.74,66.64 46.1,65.28 46.1,64.52
B5: length 11.2
  Bottom Layer w0.254: 46.1,67.06 44.57,68.59 43.55,68.59 41.78,70.36 41.78,71.12 40.89,72.01 39.24,72.01 U9.29
B6: length 9.3
  Top Layer w0.254: 43.56,64.52 43.56,65.28 42.29,66.55 42.29,67.56 41.4,68.45 40.39,68.45 37.97,70.87
B7: length 11.1
  Bottom Layer w0.254: 43.56,67.06 42.8,67.06 39.31,70.55 39.31,71.18 38.48,72.01 36.7,72.01 U9.30
B11: length 7.9
  Bottom Layer w0.254: U10.30 79.12,22.22 77.85,23.49 77.85,26.56 79.12,27.83 79.12,28.7
BOOT0: length 7.6
  Top Layer w0.254: 32.89,70.87 32.89,70.36 34.67,68.58 34.67,65.79 35.94,64.52
BOOT1: length 9.2
  Bottom Layer w0.254: U9.32 31.62,72.01 31.62,70.23 32.38,69.47 33.53,69.47 35.94,67.06
C1: length 9.5
  Bottom Layer w0.254: 46.1,28.7 46.1,28.45 47.37,27.18 47.37,24.78 50.31,21.84 U10.8
C2: length 18
  Top Layer w0.254: U10.13 58.8,18.41 57.91,17.53 53.34,17.53 52.36,18.51 52.36,20.03 51.82,20.57 50.67,20.57 49.82,21.43 49.82,24.98 48.64,26.16
C3: length 9
  Bottom Layer w0.254: U10.10 50,25.56 50,27.34 48.64,28.7
C5: length 7.9
  Bottom Layer w0.254: 61.34,28.7 62.61,27.43 62.61,24.38 63.88,23.11 U10.18
C8: length 11.3
  Bottom Layer w0.254: 63.37,70.87 66,68.23 66.91,68.23 67.6,67.54 67.6,66.64 68.54,65.69 69.45,65.69 70.63,64.52 71.5,64.52
C9: length 13.6
  Bottom Layer w0.254: 71.5,67.06 70.6,67.95 69.73,67.95 69.36,68.33 67.82,68.33 66.32,69.83 65.48,69.83 64.87,70.44 64.87,71.04 63.68,72.24 62.81,72.24 61.77,73.28 U9.20
C10: length 9.2
  Bottom Layer w0.254: 61.34,64.52 61.34,65.28 59.98,66.64 59.98,67.54 59.29,68.23 58.38,68.23 55.75,70.87
C11: length 11.2
  Bottom Layer w0.254: 61.34,67.06 59.69,68.71 58.67,68.71 56.9,70.48 56.9,71.25 56.01,72.14 54.74,72.14 53.59,73.28 U9.23
C13: length 9
  Bottom Layer w0.254: U10.6 48.64,21.95 44.74,25.86 44.74,27.52 43.56,28.7
D0: length 11.3
  Bottom Layer w0.254: U9.24 51.05,73.28 52.32,72.01 53.85,72.01 54.36,71.5 54.36,70.48 56.13,68.71 57.15,68.71 58.8,67.06
D1: length 9.2
  Bottom Layer w0.254: 50.67,70.87 53.3,68.23 54.21,68.23 54.9,67.54 54.9,66.64 56.26,65.28 56.26,64.52
D3: length 9.2
  Bottom Layer w0.254: 48.13,70.87 50.76,68.23 51.67,68.23 52.36,67.54 52.36,66.64 53.72,65.28 53.72,64.52
D4: length 11.1
  Bottom Layer w0.254: U9.26 45.97,73.28 47.24,72.01 48.77,72.01 49.4,71.37 49.4,70.66 51.36,68.71 52.07,68.71 53.72,67.06
D5: length 9.3
  Bottom Layer w0.254: 45.59,70.87 48.22,68.23 49.24,68.23 49.91,67.56 49.91,66.55 51.18,65.28 51.18,64.52
D6: length 11.2
  Bottom Layer w0.254: 51.18,67.06 49.53,68.71 48.51,68.71 46.74,70.48 46.74,71.25 45.97,72.01 44.83,72.01 43.56,73.28 U9.27
D7: length 9.2
  Bottom Layer w0.254: 43.05,70.87 45.68,68.23 46.59,68.23 47.28,67.54 47.28,66.64 48.64,65.28 48.64,64.52
D8: length 19
  Bottom Layer w0.254: 68.45,70.87 76.98,70.87 80.48,67.36 80.48,66.33 81.03,65.79 82.93,65.79 84.2,64.52
D9: length 18.3
  Bottom Layer w0.254: 84.2,67.06 77.98,73.28 U9.17
D10: length 19
  Bottom Layer w0.254: 65.91,70.87 66.29,70.87 67.94,69.22 76.2,69.22 77.76,67.66 77.76,66.64 78.61,65.79 79.89,65.79 81.16,64.52 81.66,64.52
D11: length 18.9
  Bottom Layer w0.254: 81.66,67.06 81.66,68.07 77.5,72.24 66.95,72.24 U9.18
D13: length 18.9
  Bottom Layer w0.254: U9.19 63.36,73.4 63.72,73.4 65.12,72 66.43,72 67.31,71.12 67.31,70.54 68.02,69.83 76.19,69.83 78.84,67.17 79,67.17 79.12,67.06
E0: length 9.3
  Bottom Layer w0.254: 35.43,70.87 36.45,70.87 39.75,67.56 39.75,65.79 38.48,64.52
E1: length 9.5
  Bottom Layer w0.254: 38.48,67.06 38.48,67.69 37.72,68.45 36.07,68.45 34.04,70.48 34.04,72.14 U9.31
E2: length 13.9
  Bottom Layer w0.254: 38.48,26.16 39.35,26.16 42.15,23.37 43.94,23.37 44.83,22.48 44.83,20.95 45.12,20.66 47.28,20.66 U10.5
E3: length 11.2
  Bottom Layer w0.254: U10.4 42.29,25.65 42.29,26.92 41.69,27.52 39.66,27.52 38.48,28.7
E4: length 13.5
  Top Layer w0.254: U10.7 50.31,19.3 49.13,20.48 45.79,20.48 44.92,21.36 44.92,22.26 41.02,26.16
E6: length 13.7
  Bottom Layer w0.254: 43.56,26.16 43.81,26.16 47.46,22.52 47.46,21.36 48.21,20.61 51.8,20.61 52.98,19.43 53.59,19.43 U10.9
E7: length 7.9
  Bottom Layer w0.254: 66.42,28.7 67.78,27.34 67.78,25.56 68.96,24.38 U10.22
E11: length 8
  Bottom Layer w0.254: 71.5,28.7 70.14,27.34 70.14,23.2 U10.24
E13: length 7.8
  Bottom Layer w0.254: 74.04,28.7 72.86,27.52 72.86,23.02 U10.26
E14: length 7.9
  Bottom Layer w0.254: 76.58,26.16 76.58,23.62 77.85,22.35 77.85,20.95 76.58,19.69 U10.27
E15: length 8
  Bottom Layer w0.254: 76.58,28.7 75.22,27.34 75.22,23.59 76.58,22.22 U10.28
KEY1: length 33.8
  Top Layer w0.254: 81.66,26.16 77.76,22.26 77.76,18.82 71.39,12.45 63.29,12.45 C4.1 57.83,6.98 U11.1
KEY2: length 33.4
  Top Layer w0.254: U12.1 66.55,7.1 C3.1 68.72,9.93 70.6,11.81 77.09,11.81 83.02,17.74 83.02,28.23 82.55,28.7 81.66,28.7
KEY3: length 24.8
  Top Layer w0.254: 84.2,26.16 86.49,23.88 86.49,18.27 C2.1 75.2,6.98 U13.1
KEY4: length 25.5
  Top Layer w0.254: U14.1 84.05,6.98 C1.1 88.52,11.45 88.52,24.38 84.2,28.7
LASER1: length 5.3
  Top Layer w0.254: R13.2 50,10.32 49.02,11.3 Q1.2
LASER_GND: length 3.2
  Bottom Layer w0.254: Q1.3 50.29,9.02 50.16,8.89
LASER_STM: length 34.3
  Top Layer w0.254: 79.12,26.16 75.4,22.44 75.4,18 72.26,14.86 55.66,14.86 R13.1
MA_UART: length 67.4
  Top Layer w0.254: v1(24,14.1) 31.36,14.1 R2.2 32,14.74 v1(32,16.13) ; v1(31.37,18.54) 31.37,18.8 28.46,21.7 28.46,30.73 R9.2 ; U3.13 26.29,5.72 v1(13.84,5.72)
  Bottom Layer w0.254: v1(24,14.1) 13.59,14.1 8.76,9.27 12.32,5.72 v1(13.84,5.72) ; v1(31.37,18.54) 32,17.91 v1(32,16.13)
OLED_SCL: length 14.6
  Top Layer w0.254: R11.2 52.84,7.77 44.72,7.77 OLED1.3
OLED_SCL_STM: length 30
  Top Layer w0.254: R11.1 55.37,13.26 v1(56.39,14.28)
  Bottom Layer w0.254: 74.04,26.16 74.04,23.75 75.31,22.48 75.31,20.57 U10.25 72.85,18.11 65.16,18.11 63.06,16 58.12,16 v1(56.39,14.28)
OLED_SDA: length 15.1
  Top Layer w0.254: R12.2 57.66,9.78 53.09,5.21 45.72,5.21 OLED1.4
OLED_SDA_STM: length 26
  Top Layer w0.254: v1(57.4,13.66) 57.4,13.19 57.66,12.94 R12.1 ; 46.1,26.16 46.61,26.16 48.64,24.13 v1(49.11,24.13)
  Bottom Layer w0.254: v1(49.11,24.13) 50.67,24.13 52.36,22.44 52.36,21.3 53.09,20.57 54.99,20.57 U10.11 56.26,18.94 53.09,15.77 53.09,14.35 53.77,13.66 v1(57.4,13.66)
PITCH_DIR: length 8.9
  Top Layer w0.254: R6.2 22.48,15.88 18.92,12.32 18.92,9.27
PITCH_DIR_STM: length 51.6
  Top Layer w0.254: 25.38,16.26 25.38,16.38 25.79,16.79 63.03,16.79 65.15,18.91 65.15,19.94 65.88,20.66 66.91,20.66 67.04,20.79 67.27,20.79 67.6,21.12 67.6,22.39 71.37,26.16 71.5,26.16
PITCH_EN: length 32.4
  Top Layer w0.254: R4.2 19.87,24.13 3.3,24.13 2.41,23.24 2.41,19.81 1.14,18.54 U2.16
PITCH_EN_STM: length 48.9
  Top Layer w0.254: v1(26.16,27.43) 25.91,27.43 22.65,24.17 R4.1 ; v1(29.84,27.43) 29.94,27.34 67.78,27.34 68.96,26.16
  Bottom Layer w0.254: v1(26.16,27.43) v1(29.84,27.43)
PITCH_STEP: length 6.7
  Top Layer w0.254: U2.10 16.87,9.75 R10.2
PITCH_STEP_STM: length 61.4
  Top Layer w0.254: R10.1 20.23,17.14 61.12,17.14 62.61,18.63 62.61,22.73 63.12,23.24 67.71,23.24 70.14,25.67 70.14,27.65 69.09,28.7 68.96,28.7
RESET: length 13.8
  Bottom Layer w0.254: U10.3 45.74,19.3 44.38,20.66 42.71,20.66 41.91,21.46 41.91,22.83 39.98,24.77 37.34,24.77 35.94,26.16
T1MS1: length 24.9
  Top Layer w0.254: v1(24.2,23.87) 24.34,23.87 25.81,22.4 25.81,19.76 v1(25.27,19.23)
  Bottom Layer w0.254: v1(25.27,19.23) 25.27,9.78 U3.15 ; v1(24.2,23.87) 22.7,25.38 17.17,25.38 16.13,26.42
T1MS2: length 26.7
  Top Layer w0.254: v1(26.92,19.18) 26.5,19.6 26.49,19.6 26.26,19.83 26.26,22.88 v1(24.26,24.89)
  Bottom Layer w0.254: v1(26.92,19.18) 26.92,9.65 U3.14 ; 16.13,28.96 17.4,27.69 21.46,27.69 v1(24.26,24.89)
T2MS1: length 18.7
  Top Layer w0.254: v1(4.83,22.99) 4.83,21.34 3.68,20.19 U2.15
  Bottom Layer w0.254: 5.97,26.54 5.97,26.8 4.83,25.65 v1(4.83,22.99)
T2MS2: length 21.2
  Top Layer w0.254: U2.14 6.22,19.05 7.49,20.32 v1(7.49,20.95)
  Bottom Layer w0.254: 5.97,29.08 6.35,29.08 7.47,27.97 7.47,20.97 v1(7.49,20.95)
UART5_RX: length 59.3
  Top Layer w0.254: GND.2 17.78,54.99 46.23,54.99 55.08,63.84 55.08,65.88 56.26,67.06
  Bottom Layer w0.254: 56.26,67.06 54.61,68.71 53.72,68.71 51.94,70.48 51.94,71.37 51.31,72.01 49.91,72.01 48.64,73.28 U9.25
UART5_TX: length 55.2
  Top Layer w0.254: 58.8,64.52 48.13,53.85 19.18,53.85 GND.3
  Bottom Layer w0.254: 58.8,64.52 58.8,65.28 57.53,66.55 57.53,67.69 56.99,68.23 55.84,68.23 53.21,70.87
UART_RX: length 56
  Top Layer w0.254: R9.1 47.29,52.07 53.97,52.07 65.06,63.16 65.06,65.06 65.88,65.88 67.78,65.88 68.96,67.06
UART_TX: length 76.4
  Top Layer w0.254: R8.1 38.32,14.7 v1(39.62,16) ; 68.96,64.52 43.94,39.5 39.24,39.5 29.08,29.34 29.08,25.91 31.37,23.62 35.05,23.62 36.19,22.48 36.19,21.77 39.42,18.54 v1(39.62,18.54)
  Bottom Layer w0.254: v1(39.62,16) v1(39.62,18.54)
YAW_DIR: length 2.6
  Top Layer w0.254: U3.9 40.5,9.27 41.44,10.21 R5.2
YAW_DIR_STM: length 26
  Top Layer w0.254: v1(57.53,18.62) 57.53,22.35 61.34,26.16 ; v1(53.72,14.72) 48.71,14.72 R5.1
  Bottom Layer w0.254: v1(57.53,18.62) 53.72,14.81 v1(53.72,14.72)
YAW_EN: length 7
  Top Layer w0.254: U3.16 22.22,10.16 24.26,12.19 R3.2
YAW_EN_STM: length 73.3
  Top Layer w0.254: R3.1 32.75,12.19 33.51,12.95 45.09,12.95 47.43,15.3 71.18,15.3 72.68,16.8 72.68,29.43 71.5,30.61 60.07,30.61 58.8,29.34 58.8,28.7
YAW_STEP: length 9.2
  Top Layer w0.254: v1(39.88,13.72) 41.15,13.72 42.71,15.28 42.71,15.6
  Bottom Layer w0.254: v1(39.88,13.72) 37.47,11.3 U3.10
YAW_STEP_STM: length 20.7
  Top Layer w0.254: 58.8,26.16 54.99,22.35 54.99,18.62 v1(55,18.62) ; v1(52.32,16.05) 45.16,16.05 44.71,15.6
  Bottom Layer w0.254: v1(52.32,16.05) 54.89,18.62 v1(55,18.62)
$1N2243: length 2.4
  Top Layer w0.254: 36.36,14.7 R2.1

## Copper pours and planes (outline as drawn; the poured copper is in the pictures)
GND on Top Layer: -6.22,81.41 98.04,81.41 98.04,-2.54 -6.22,-2.54
GND on Bottom Layer: -4.7,77.22 99.06,77.22 99.06,-5.33 -4.7,-5.33

Small or netless copper shapes (teardrops, artwork), in the pictures only: 109 on Top Layer, 156 on Bottom Layer

## Text on the board
Bottom Silkscreen Layer: 2A+ | IN- | IN+ | 2B+ | 2A- | 2B- | 1A+ | OUT- | 1B+ | OUT+ | 1A- | 1B- | NONE | 12VI | 12VO | 12VIN
Top Silkscreen Layer: R22 | Tmc1_MS2 | Tmc1_MS1 | R1k | R4.7 | C_100 | GND | 3.3v | RX | TX | KEY1 | KEY2 | KEY3 | KEY4 | Tmc2_MS2 | Tmc2_MS1 | -> | 3V3 | SCL | 5V | SDA | RST | E3 | C13 | E2 | C1 | E4 | C3 | E6 | O_A | A1 | A3 | C2 | A5 | A2 | C5 | B1 | E7 | B0 | D0 | D1 | E11 | B2 | O_L | C11 | C12 | E13 | E15 | E14 | A15 | C10 | 3.3V | B11 | A11 | A12 | C9 | A8 | D13 | C8 | D11 | D10 | D9 | D8 | BOOT1 | BOOT0 | E1 | B7 | E0 | B5 | B6 | B3 | B4 | D6 | D7 | D4 | D5 | D2 | D3
